# Altium project variants-project.PrjPcb
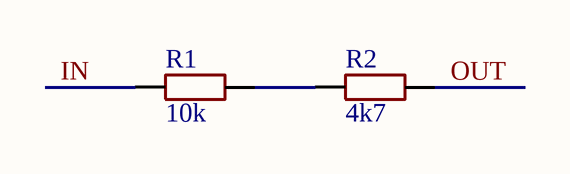
[diagram p0: variants.SchDoc]
1 sheet, 2 parts. Net scope: global (net labels, ports and power ports of the same name join across sheets).
Board file: variants-board.PcbDoc

## Sheet variants.SchDoc
size A4; SheetNumber: 1; SheetTotal: 1

### Parts
R1  10k  [R0603-TEST]
R2  4k7  [R0603-TEST]

### Nets
IN: R1.1
OUT: R2.2
NetR1_2: R1.2 R2.1

### Library data of the parts
R1 R2 = RES-TEST: Resistor, test symbol

## Assembly variants
Lite: not fitted R2
Alt: all parts fitted